# EasyEDA Pro project 双电机编码器.epro

# Schematic Schematic1
Board Name: Board1; Create Date: 2024-12-01; Page Name: P1; Project Name: Project; Schematic Name: Schematic1; Update Date: 2025-03-04; Company: 嘉立创EDA; Page Size: A4; Version: V1.0
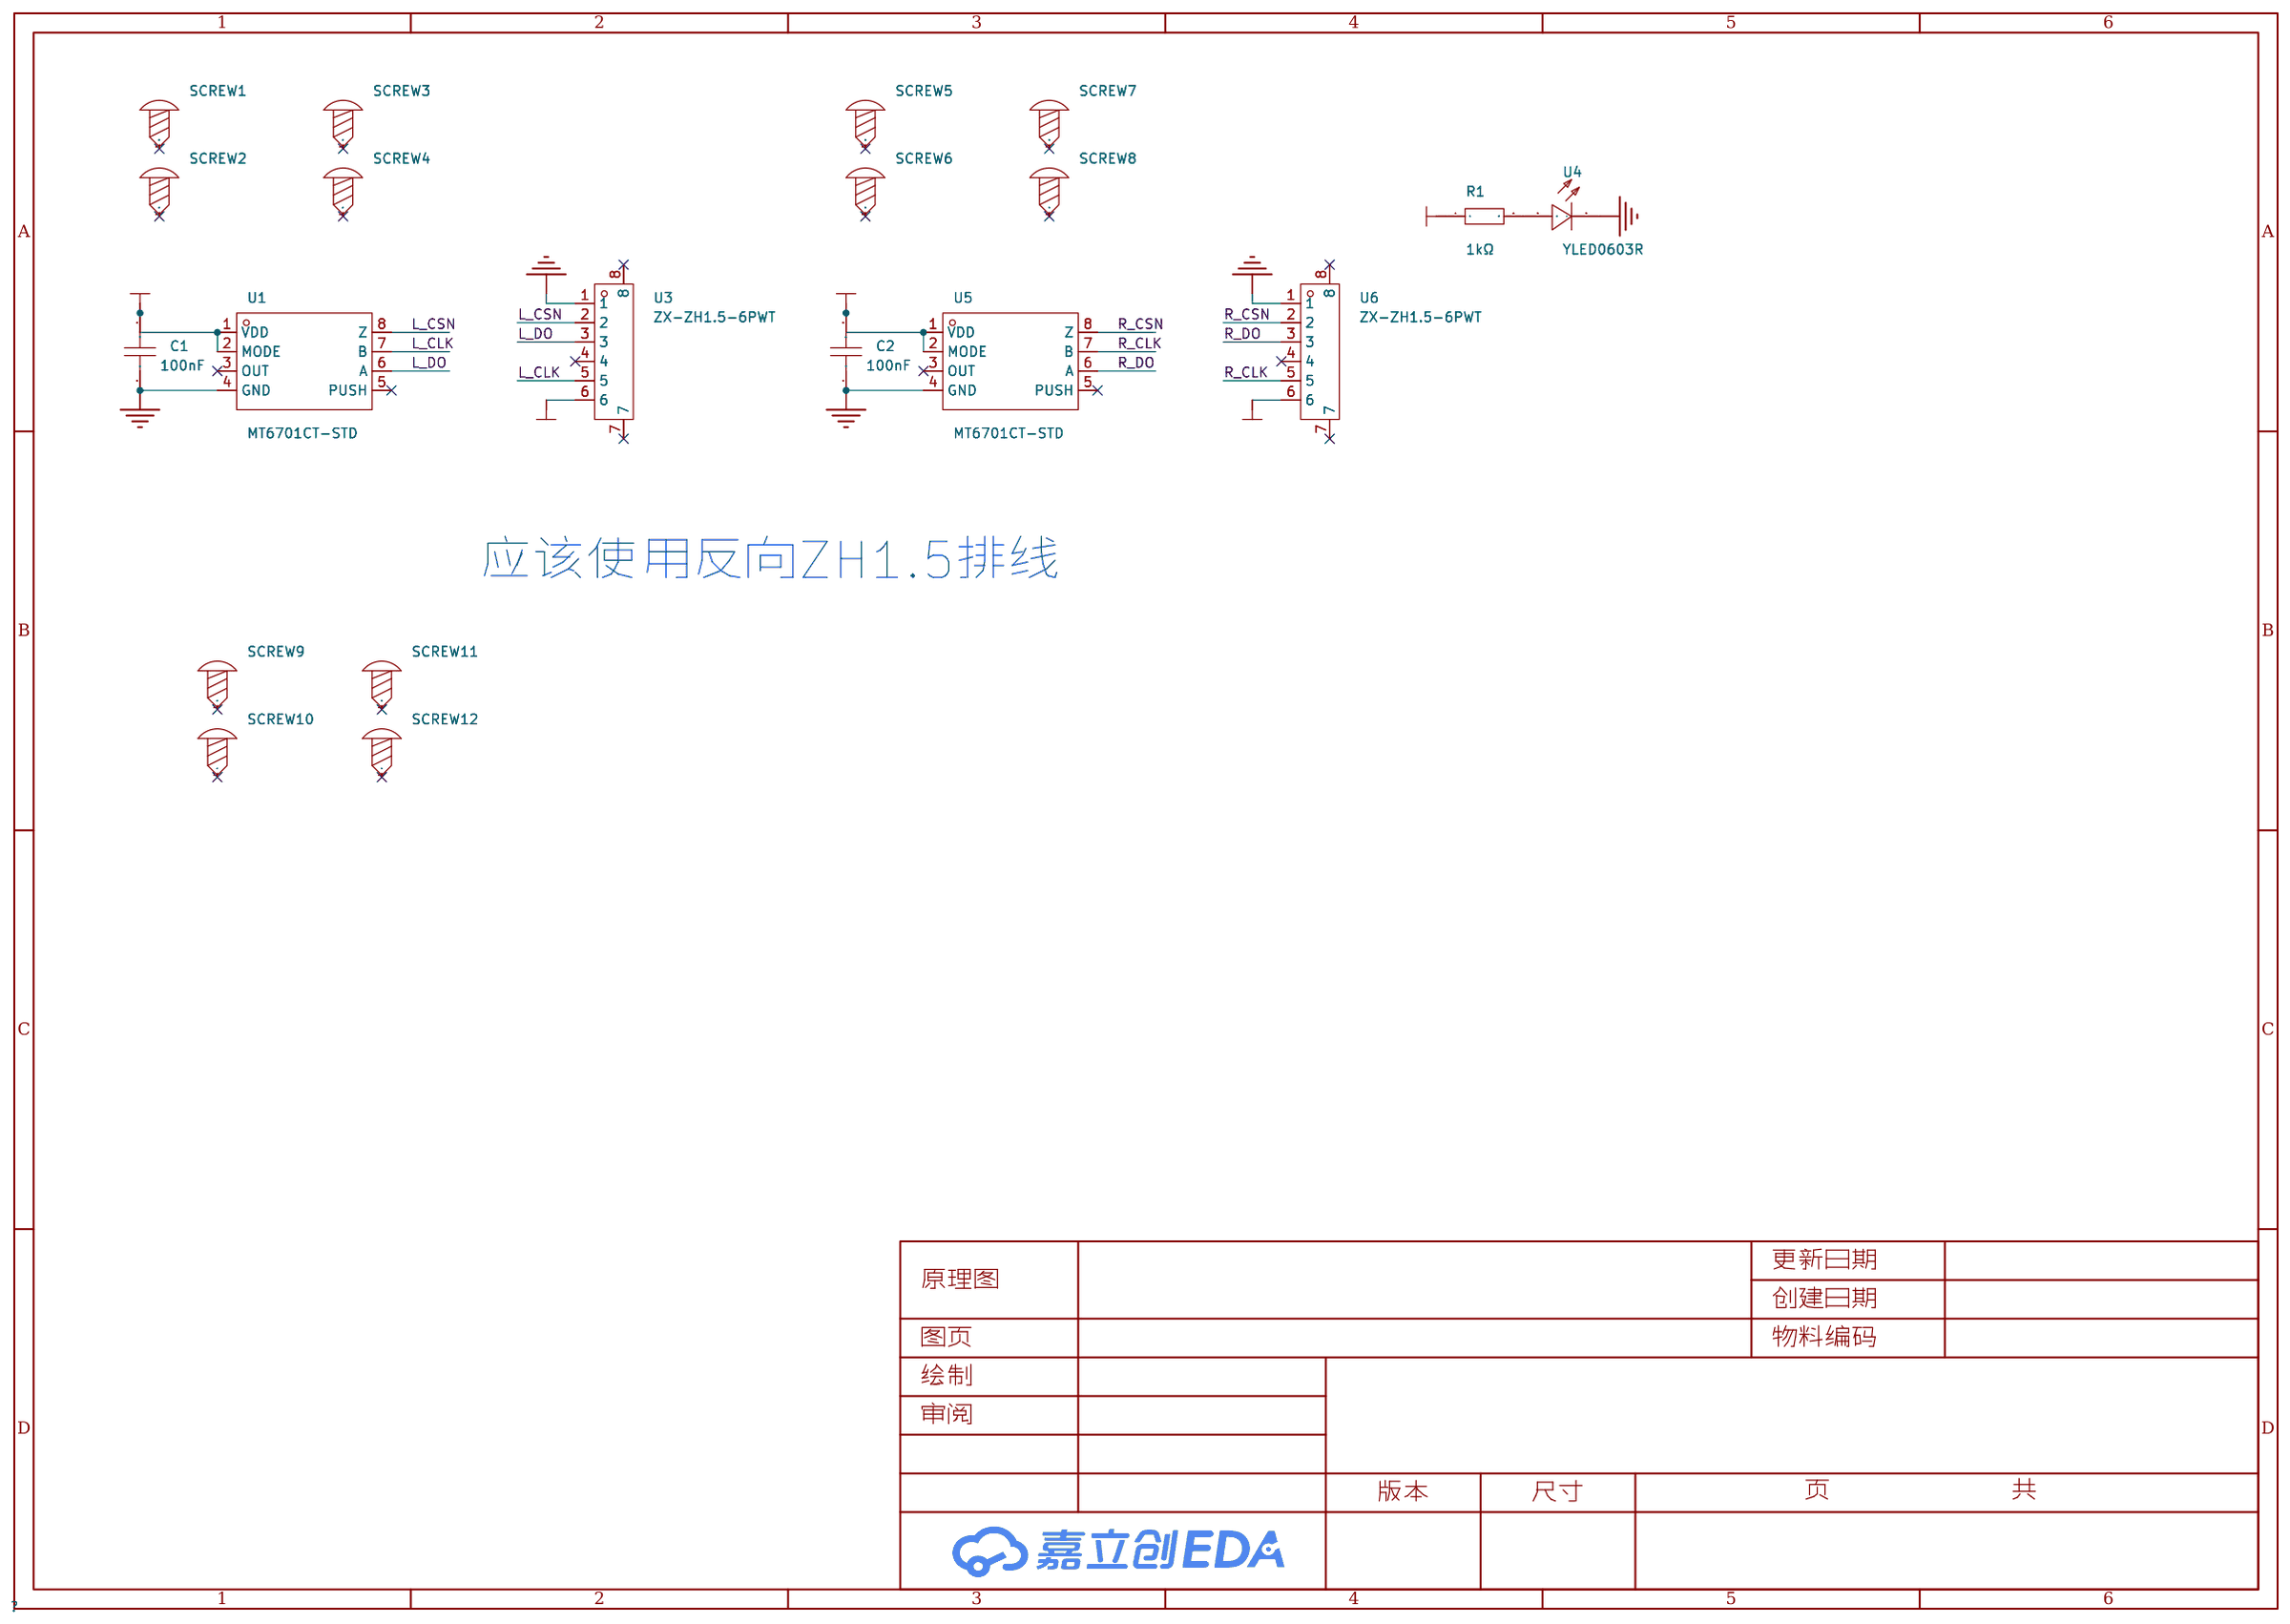
[diagram p0: schematic sheet]

## Parts
C1  100nF  [C0603]
C2  100nF  [C0603]
R1  1kΩ  [R0603]
SCREW1  -  [M3螺丝]
SCREW2  -  [M3螺丝]
SCREW3  -  [M3螺丝]
SCREW4  -  [M3螺丝]
SCREW5  -  [M3螺丝]
SCREW6  -  [M3螺丝]
SCREW7  -  [M3螺丝]
SCREW8  -  [M3螺丝]
SCREW9  -  [M3螺丝]
SCREW10  -  [M3螺丝]
SCREW11  -  [M3螺丝]
SCREW12  -  [M3螺丝]
U1  MT6701CT-STD  [SOP-8_L4.9-W3.9-P1.27-LS6.0-BL]
U3  ZX-ZH1.5-6PWT  [CONN-SMD_6P-P1.50_ZX-ZH1.5-6PWT]
U4  YLED0603R  [LED0603-FD]
U5  MT6701CT-STD  [SOP-8_L4.9-W3.9-P1.27-LS6.0-BL]
U6  ZX-ZH1.5-6PWT  [CONN-SMD_6P-P1.50_ZX-ZH1.5-6PWT]

## Library data of the parts
C1 C2 = CC0603KRX7R9BB104: 容值:100nF;精度:±10%;额定电压:50V;材质(温度系数):X7R;; LCSC Part Name: 100nF ±10% 50V; Supplier Part: C14663; Manufacturer: YAGEO(国巨); Supplier Footprint: 0603; JLCPCB Part Class: 基础库; Datasheet: https://atta.szlcsc.com/upload/public/pdf/source/20180910/C282072_33301C7F631E79921B82A8DAC6BCC5B3.pdf; Supplier: LCSC; Tolerance: ±10%; Voltage Rated: 50V; Temperature Coefficient: X7R
R1 = 0603WAF1001T5E: 电阻类型:厚膜电阻;阻值:1kΩ;精度:±1%;功率:100mW;最大工作电压:75V;温度系数:±100ppm/℃;; LCSC Part Name: 1kΩ ±1% 100mW 厚膜电阻; Supplier Part: C21190; Manufacturer: UNI-ROYAL(厚声); Supplier Footprint: 0603; JLCPCB Part Class: 基础库; Datasheet: https://atta.szlcsc.com/upload/public/pdf/source/20200306/C422600_1E6D84923E4A46A82E41ADD87F860B5C.pdf; Supplier: LCSC; Type: 厚膜电阻; Tolerance: ±1%; Power(Watts): 100mW; Overload Voltage (Max): 75V; Temperature Coefficient: ±100ppm/℃; Operating Temperature Range: -55℃~+155℃
SCREW1-SCREW12 = M3螺丝: Supplier Footprint: 插件
U1 U5 = MT6701CT-STD: 磁性编码器 磁性编码开关 磁性角度检测IC 可编程磁性角度位置芯片; LCSC Part Name: 霍尔在线编程角度位置传感器; Supplier Part: C2856764; Manufacturer: MagnTek(麦歌恩); Supplier Footprint: SOP-8; JLCPCB Part Class: 扩展库; Datasheet: https://atta.szlcsc.com/upload/public/pdf/source/20210901/89396AA55DF26524CEF7734A3D9C2FB3.pdf; Supplier: LCSC
U3 U6 = ZX-ZH1.5-6PWT: 插针结构:1x6P;间距:1.5mm;安装方式:卧贴;参考系列:ZH;总PIN数:6P;排数:1;每排PIN数:6;行距:-;额定电流:1A;触头材质:黄铜;触头镀层:锡;工作温度范围:-25℃~+85℃;; LCSC Part Name: 1x6P 间距:1.5mm 卧贴 系列:ZH; Supplier Part: C19272409; Manufacturer: Megastar(兆星); Supplier Footprint: SMD,P=1.5mm,卧贴; JLCPCB Part Class: 扩展库; Datasheet: https://atta.szlcsc.com/upload/public/pdf/source/20231201/C5A824B953C40A6060EBF5A541254C86.pdf; Supplier: LCSC; Pins Structure: 1x6P; Pitch: 1.5mm; Mounting Type: 卧贴; Reference Series: ZH; Number of Pins: 6P; Number of Rows: 1; Number of PINs Per Row: 6; Rated Current: 1A; Contact Material: 黄铜; Contact Plating: 锡; Operating Temperature: -25℃~+85℃; Rated Voltage (Max): 250V; Plastic Material: LCP; Supplementary Features: 辅助焊脚; Color: 米色; Z-Height of the Board: 3.8mm; X-Length of Bottom Edge on Board (Spacing Line): 12mm; Y-Width of Bottom Edge on Board: 6.5mm
U4 = YLED0603R: 发光颜色:红色;正向电压(VF):1.8V~2.4V;功率:-;正向电流:25mA;主波长:620nm~625nm;二极管配置:-;透镜颜色:-;色温:-;发光强度:-;发光角度:-;载带方式:-;工作温度:-40℃~+85℃;; Supplier Part: C19171390; Manufacturer: YONGYUTAI(永裕泰); Supplier Footprint: 0603; JLCPCB Part Class: 扩展库; Datasheet: https://atta.szlcsc.com/upload/public/pdf/source/20231027/FB19AF06E2C70028E58AB5CEDD1BDC72.pdf; Supplier: LCSC; Emitted Color: 红色; Forward Voltage (VF): 1.8V~2.4V; Forward Current: 25mA; Dominant Wavelength: 620nm~625nm; Operating Temperature: -40℃~+85℃

## Nets
3.3V: C1.2 C2.2 R1.1 U1.1(VDD) U1.2(MODE) U3.6 U5.1(VDD) U5.2(MODE) U6.6
GND: C1.1 C2.1 U1.4(GND) U3.1 U4.2(-) U5.4(GND) U6.1
L_CLK: U1.7(B) U3.5
L_CSN: U1.8(Z) U3.2
L_DO: U1.6(A) U3.3
R_CLK: U5.7(B) U6.5
R_CSN: U5.8(Z) U6.2
R_DO: U5.6(A) U6.3
$1N1168: R1.2 U4.1(+)

Not connected (* = marked no-connect by the designer): SCREW1 1*; SCREW2 1*; SCREW3 1*; SCREW4 1*; SCREW5 1*; SCREW6 1*; SCREW7 1*; SCREW8 1*; SCREW9 1*; SCREW10 1*; SCREW11 1*; SCREW12 1*; U1 3(OUT)* 5(PUSH)*; U3 4* 7* 8*; U5 3(OUT)* 5(PUSH)*; U6 4* 7* 8*

## Notes on the sheet
- 应该使用反向ZH1.5排线

# Board PCB1
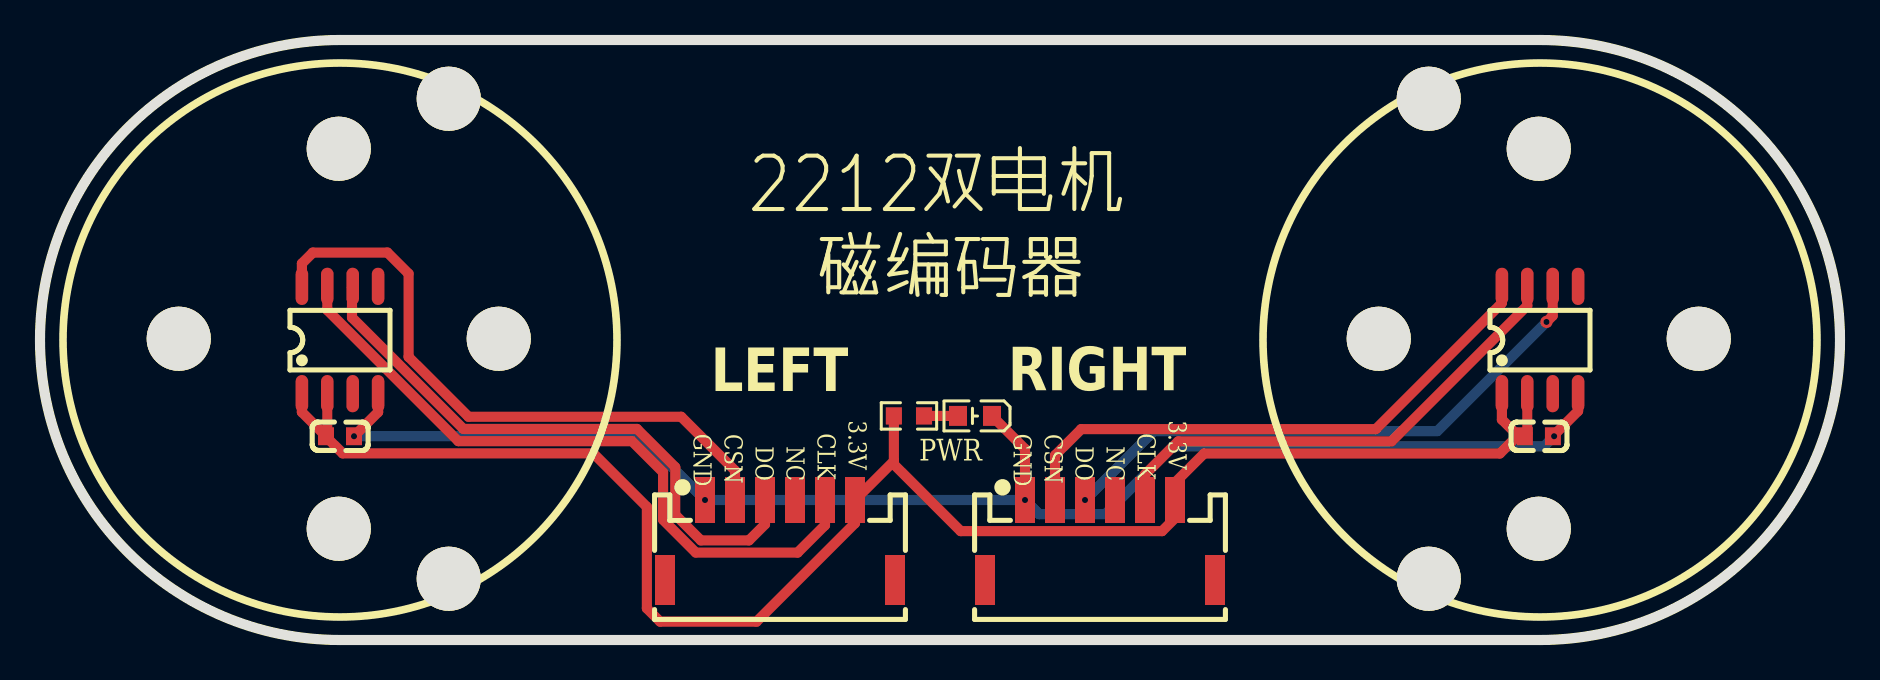
[diagram p1: board, top side]
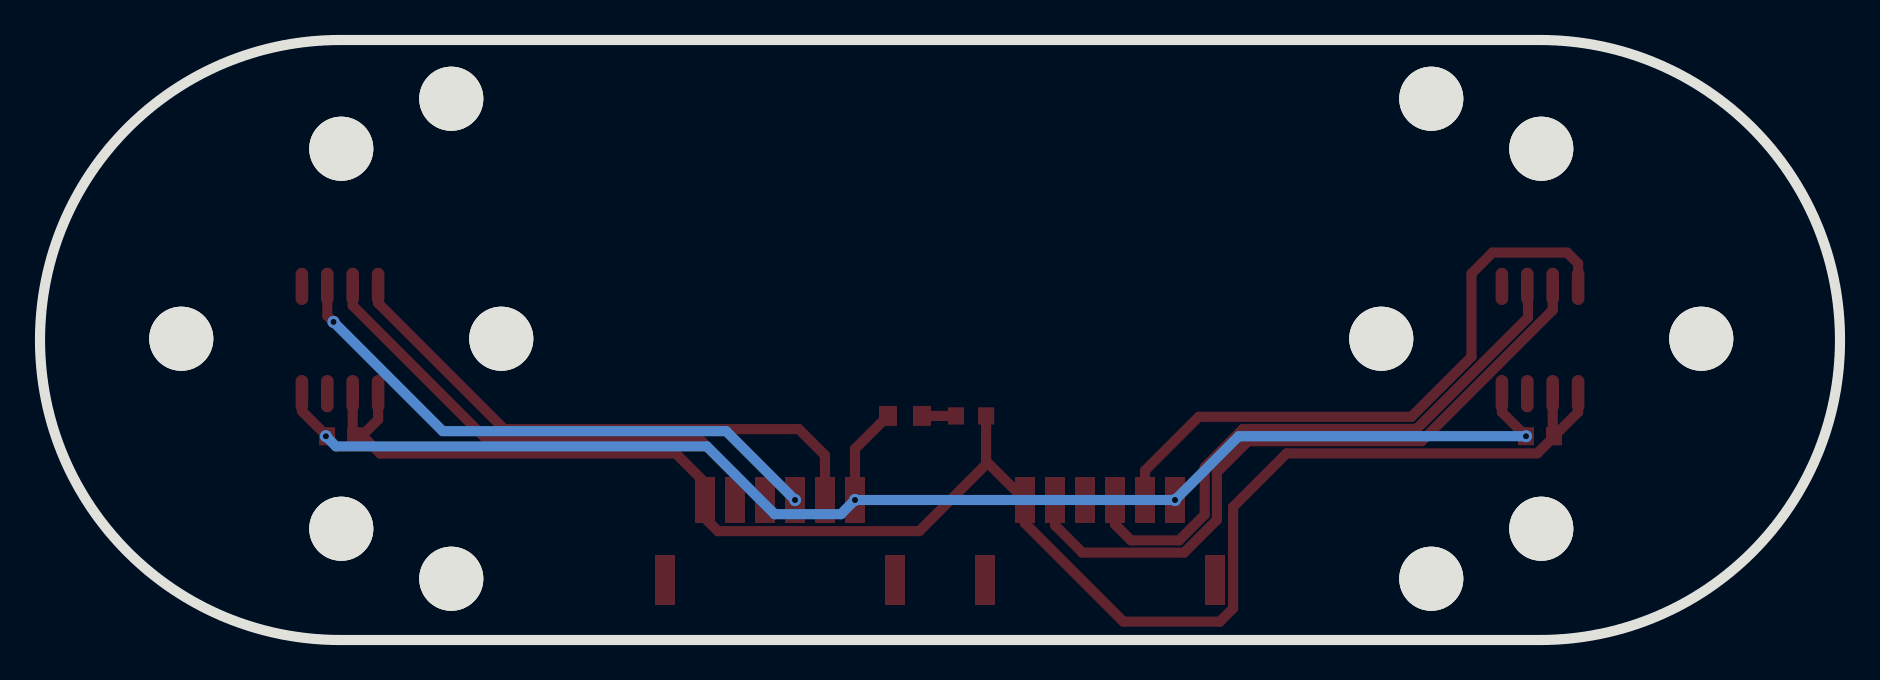
[diagram p2: board, bottom side, seen from below]

Outline 90 x 30 mm; copper layers: Top Layer, Bottom Layer. Coordinates in mm from the lower left corner of the outline.
Outline path: 15,30 75,30 arc(90,15) 75,0 15,0 arc(0,15) 15,30
Stack: Top Layer 0.035mm / Dielectric1 1.51mm FR4 er 4.5 / Bottom Layer 0.035mm

## Design rules (mm)
template: JLCPCB Capability(Two Layers Board)
spacing copperThickness1oz (default): track to track 0.102, other pairs 0.152 to 0.3
spacing copperThickness2oz: track to track 0.203, other pairs 0.152 to 0.3
track width copperThickness1oz (default): min 0.127, default 0.254, max 2.54
track width copperThickness2oz: min 0.203, default 0.254, max 2.54
differential pair differentialPair (default): width min 0.127, default 0.254, max 2.54; gap min 0.152, default 0.152
via viaSize (default): diameter min 0.5, default 0.61, max 10; hole min 0.3, default 0.305, max 6.3

## Placement (name value [footprint] x y rotation side)
C1  100nF  [C0603]  15 10.19 180 top
C2  100nF  [C0603]  74.94 10.19 180 top
R1  1kΩ  [R0603]  43.45 11.2 0 top
SCREW1  -  [M3螺丝]  67 15 0 top
SCREW2  -  [M3螺丝]  75 5.5 0 top
SCREW3  -  [M3螺丝]  83 15 0 top
SCREW4  -  [M3螺丝]  75 24.5 0 top
SCREW5  -  [M3螺丝]  7 15 0 top
SCREW6  -  [M3螺丝]  23 15 0 top
SCREW7  -  [M3螺丝]  15 24.5 0 top
SCREW8  -  [M3螺丝]  15 5.5 0 top
SCREW9  -  [M3螺丝]  20.5 27 0 top
SCREW10  -  [M3螺丝]  69.5 27 0 top
SCREW11  -  [M3螺丝]  20.5 3 0 top
SCREW12  -  [M3螺丝]  69.5 3 0 top
U1  MT6701CT-STD  [SOP-8_L4.9-W3.9-P1.27-LS6.0-BL]  15 15 0 top
U3  ZX-ZH1.5-6PWT  [CONN-SMD_6P-P1.50_ZX-ZH1.5-6PWT]  37 5 0 top
U4  YLED0603R  [LED0603-FD]  46.75 11.2 0 top
U5  MT6701CT-STD  [SOP-8_L4.9-W3.9-P1.27-LS6.0-BL]  75 15 0 top
U6  ZX-ZH1.5-6PWT  [CONN-SMD_6P-P1.50_ZX-ZH1.5-6PWT]  53 5 0 top

## Footprints (pads in the part's own frame, mm; a bottom-side part is the same pattern mirrored in y, then rotated)
C0603
  rect 0.8x0.9 smd: 1(-0.7,0) 2(0.7,0)
CONN-SMD_6P-P1.50_ZX-ZH1.5-6PWT
  rect 1x2.3 smd: 1(-3.75,2) 2(-2.25,2) 3(-0.75,2) 4(0.75,2) 5(2.25,2) 6(3.75,2)
  rect 1x2.5 smd: 7(5.75,-2) 8(-5.75,-2)
LED0603-FD
  rect 0.9x1 smd: 1(-0.85,0) 2(0.85,0)
M3螺丝
  round 3.2 hole 3.2: 1(-0.064,0.064)
R0603
  rect 0.806x0.864 smd: 1(-0.753,0) 2(0.753,0)
SOP-8_L4.9-W3.9-P1.27-LS6.0-BL
  oval 0.63x1.865 smd: 1(-1.905,-2.683) 2(-0.635,-2.683) 3(0.635,-2.683) 4(1.905,-2.683) 5(1.905,2.683) 6(0.635,2.683) 7(-0.635,2.683) 8(-1.905,2.683)

## Nets
As in the schematic.

Pads without a net: SCREW1 1; SCREW2 1; SCREW3 1; SCREW4 1; SCREW5 1; SCREW6 1; SCREW7 1; SCREW8 1; SCREW9 1; SCREW10 1; SCREW11 1; SCREW12 1; U1 3 5; U3 4 7 8; U5 3 5; U6 4 7 8

## Via types
v1: diameter 0.61, hole 0.305, Top Layer to Bottom Layer, 6 vias

## Routing (per net, layer and track width the routed paths; a pad name or vN(x,y) marks a point on that pad's centre or on a via; arc(x,y) is an arc through that point)
3.3V: length 87
  Top Layer w0.508: 42.69,8.94 42.69,8.78 46.03,5.44 56.1,5.44 56.75,6.09 U6.6 56.75,7.87 58.21,9.32 72.99,9.32 73.86,10.19 ; 42.69,8.94 U3.6 40.75,5.84 35.83,0.92 31.01,0.92 30.34,1.58 30.34,6.66 27.67,9.33 15.13,9.33 14.29,10.18 C1.2 ; 42.69,8.94 R1.1 ; C1.2 13.09,11.39 U1.1 ; C1.2 14.36,10.25 U1.2 ; 73.86,10.19 C2.2 74.37,10.31 U5.2 ; 73.86,10.19 73.86,10.26 73.09,11.02 U5.1
GND: length 73.4
  Top Layer w0.508: U5.4 76.91,11.45 C2.1 ; v1(49.25,7) 49.25,9.55 U4.2 ; v1(15.7,10.19) 16.91,11.39 U1.4
  Bottom Layer w0.508: v1(15.7,10.19) 30.06,10.19 v1(33.25,7) v1(49.25,7) 49.96,6.29 53.26,6.29 56.66,9.68 75.2,9.68 v1(75.71,10.19)
L_CLK: length 34.3
  Top Layer w0.508: U1.7 14.36,16.49 20.92,9.94 29.6,9.94 31.15,8.39 31.15,6.01 32.79,4.37 37.88,4.37 39.25,5.74 U3.5
L_CSN: length 31.4
  Top Layer w0.508: U3.2 34.75,8.47 32.06,11.16 21.42,11.16 18.43,14.16 18.43,18.32 17.37,19.37 13.64,19.37 13.09,18.82 U1.8
L_DO: length 29.8
  Top Layer w0.508: U3.3 36.25,5.78 35.45,4.98 33.04,4.98 31.76,6.26 31.76,8.64 29.85,10.55 21.17,10.55 15.6,16.12 15.6,17.65 U1.6
R_CLK: length 24.8
  Top Layer w0.508: U5.7 74.37,16.72 67.58,9.93 56.91,9.93 55.25,8.27 U6.5
R_CSN: length 28.6
  Top Layer w0.508: U5.8 73.09,16.85 66.79,10.54 52.06,10.54 50.75,9.23 U6.2
R_DO: length 28.7
  Top Layer w0.508: v1(75.32,15.9) 75.63,16.21 U5.6
  Bottom Layer w0.508: v1(75.32,15.9) 69.86,10.44 55.69,10.44 v1(52.25,7)
$1N1168: length 1.7
  Top Layer w0.508: U4.1 R1.2

## Text on the board
Top Silkscreen Layer: LEFT | RIGHT | 2212双电机 / 磁编码器 | GND | CSN | DO | NC | CLK | 3.3V | PWR
